# Altium project Hub_CAN_4ports.PrjPcb
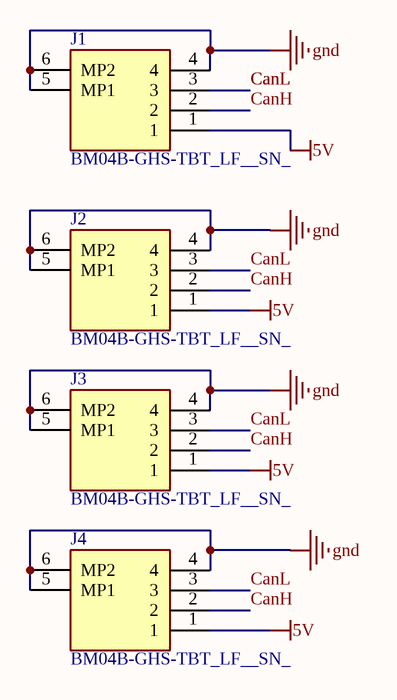
[diagram p0: Schem.SchDoc]
1 sheet, 4 parts. Net scope: global (net labels, ports and power ports of the same name join across sheets).
Board file: PCB.PcbDoc

## Sheet Schem.SchDoc
size A4; SheetNumber: 1; SheetTotal: 1

### Parts
J1  BM04B-GHS-TBT_LF__SN_  [BM04BGHSTBTLFSN]
J2  BM04B-GHS-TBT_LF__SN_  [BM04BGHSTBTLFSN]
J3  BM04B-GHS-TBT_LF__SN_  [BM04BGHSTBTLFSN]
J4  BM04B-GHS-TBT_LF__SN_  [BM04BGHSTBTLFSN]

### Nets
5V: J1.1 J2.1 J3.1 J4.1
gnd: J1.4 J1.5(MP1) J1.6(MP2) J2.4 J2.5(MP1) J2.6(MP2) J3.4 J3.5(MP1) J3.6(MP2) J4.4 J4.5(MP1) J4.6(MP2)
CanH: J1.2 J2.2 J3.2 J4.2
CanL: J1.3 J2.3 J3.3 J4.3

### Library data of the parts
J1-J4 = BM04B-GHS-TBT_LF__SN_: Connector; Manufacturer_Name: JST (JAPAN SOLDERLESS TERMINALS); Manufacturer_Part_Number: BM04B-GHS-TBT(LF)(SN); Datasheet Link: https://g.componentsearchengine.com/ga/3Dstep; Height: 4.2mm; Mouser Part Number: 306-BM04BGHSTBTLFSNN; Mouser Price/Stock: https://www.mouser.co.uk/ProductDetail/JST-Commercial/BM04B-GHS-TBTLFSN?qs=cdbOS8ANM9DuBD4arU9XYQ%3D%3D